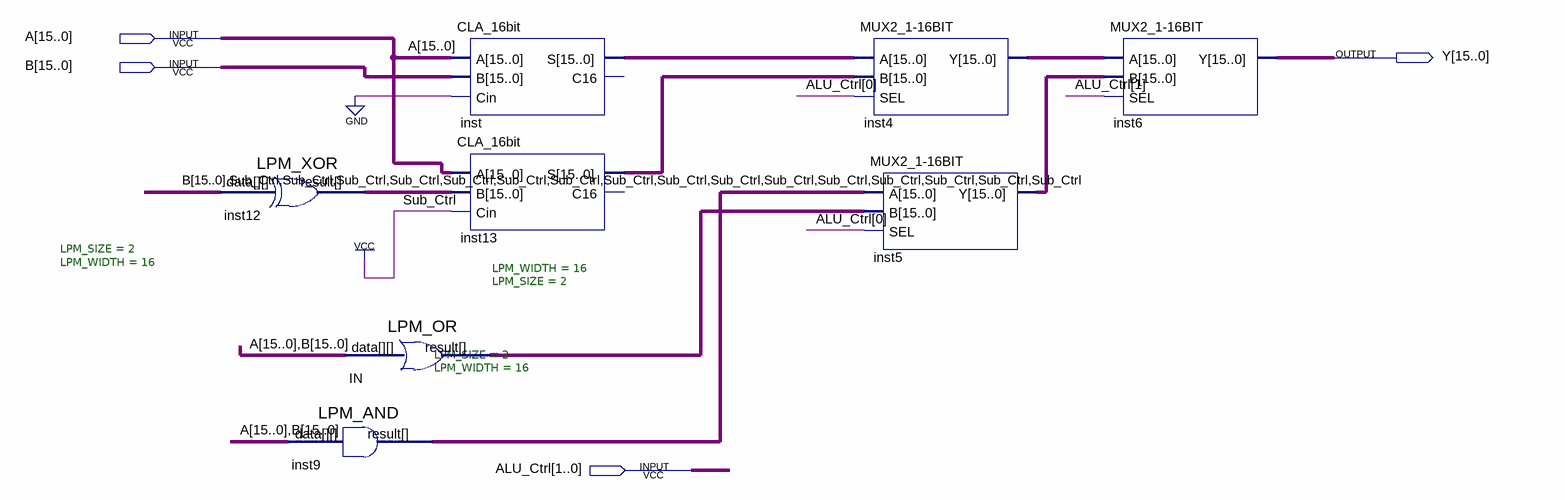
[diagram p0: schematic sheet]
// Quartus schematic ALU_16bit.bdf as structural Verilog: 8 symbols, 4 pins
module ALU_16bit (
  input  [15:0] A,
  input  [15:0] B,
  input  [1:0] ALU_Ctrl,
  output [15:0] Y
);

  wire [15:0] IN_result, inst4_y, inst5_y, inst9_result, inst12_result, inst13_s, inst_s;

  LPM_XOR #(.LPM_SIZE(2), .LPM_WIDTH(16)) inst12 (.data({B, {16{1'b1}}}), .result(inst12_result));
  LPM_AND #(.LPM_SIZE(2), .LPM_WIDTH(16)) inst9 (.data({A, B}), .result(inst9_result));
  LPM_OR #(.LPM_WIDTH(16), .LPM_SIZE(2)) IN (.data({A, B}), .result(IN_result));
  CLA_16bit inst (.A(A), .B(B), .Cin(1'b0), .S(inst_s));  // open: C16
  CLA_16bit inst13 (.A(A), .B(inst12_result), .Cin(1'b1), .S(inst13_s));  // open: C16
  \MUX2_1-16BIT  inst4 (.A(inst_s), .B(inst13_s), .SEL(ALU_Ctrl[0]), .Y(inst4_y));
  \MUX2_1-16BIT  inst5 (.A(inst9_result), .B(IN_result), .SEL(ALU_Ctrl[0]), .Y(inst5_y));
  \MUX2_1-16BIT  inst6 (.A(inst4_y), .B(inst5_y), .SEL(ALU_Ctrl[1]), .Y(Y));
endmodule
